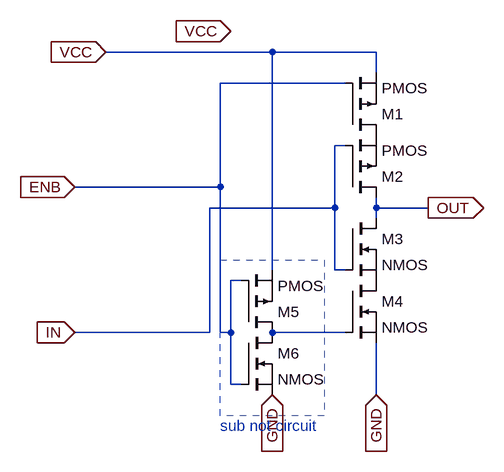
[diagram p0: schematic cmos_inv_tristate_comp.asc]
cmos_inv_tristate_comp.asc, the LTspice schematic file:
Version 4.1
SHEET 1 880 680
WIRE 64 32 -192 32
WIRE 224 32 64 32
WIRE 224 64 224 32
WIRE 176 80 -16 80
WIRE 176 176 160 176
WIRE -16 240 -16 80
WIRE -16 240 -240 240
WIRE 160 272 160 176
WIRE 160 272 -32 272
WIRE 224 272 224 256
WIRE 304 272 224 272
WIRE 224 288 224 272
WIRE 64 368 64 32
WIRE 160 368 160 272
WIRE 176 368 160 368
WIRE 16 384 0 384
WIRE -32 464 -32 272
WIRE -32 464 -240 464
WIRE -16 464 -16 240
WIRE 0 464 0 384
WIRE 0 464 -16 464
WIRE 176 464 64 464
WIRE 0 544 0 464
WIRE 16 544 0 544
WIRE 224 560 224 480
FLAG -240 240 ENB
IOPIN -240 240 In
FLAG -240 464 IN
IOPIN -240 464 In
FLAG 224 560 GND
IOPIN 224 560 In
FLAG 64 560 GND
IOPIN 64 560 In
FLAG 304 272 OUT
IOPIN 304 272 Out
FLAG -192 32 VCC
IOPIN -192 32 In
FLAG 0 0 VCC
IOPIN 0 0 In
SYMBOL pmos 176 160 M180
SYMATTR InstName M1
SYMBOL pmos 176 256 M180
SYMATTR InstName M2
SYMBOL nmos 176 288 R0
SYMATTR InstName M3
SYMBOL nmos 176 384 R0
SYMATTR InstName M4
SYMBOL pmos 16 464 M180
SYMATTR InstName M5
SYMBOL nmos 16 464 R0
SYMATTR InstName M6
TEXT -16 608 Left 2 ;sub not circuit
RECTANGLE Normal 144 592 -16 352 1

The netlist it stands for:
* cmos_inv_tristate_comp.asc
M1 P001 ENB VCC VCC PMOS
M2 OUT IN P001 P001 PMOS
M3 OUT IN P002 P002 NMOS
M4 P002 N001 GND GND NMOS
M5 N001 ENB VCC VCC PMOS
M6 N001 ENB GND GND NMOS
.model NMOS NMOS
.model PMOS PMOS
.lib standard.mos
* sub not circuit
.backanno
.end